# Altium schematic sheet 09_DIGITAL_IO.SchDoc: Схема электрическая принципиальная
size 420 x 297 mm; ApprovedBy: Скрябин; CheckedBy: Скрябин; Author: Корсунов; CompanyName: РТУ МИРЭА; SheetNumber: 9; SheetTotal: 11; PageSetup: Record=PageOptions|CenterHorizontal=True|CenterVertical=True|PrintScale=0.94|XCorrection=1.00|YCorrection=1.00|PrintKind=1|BorderSize=5000000|LeftOffset=0|BottomOffset=0|Orientation=1|PaperLength=1000|PaperWidth=1000|Scale=100|PaperSource=7|PrintQuality=-4|MediaType=1|DitherType=10|PaperKind=A4|PrintScaleMode=1; DecimalNumber: RP23.000001.009 Э3; Name1: Модуль ввода-вывода; lit_A: О; Name2: RP2350 OPC UA
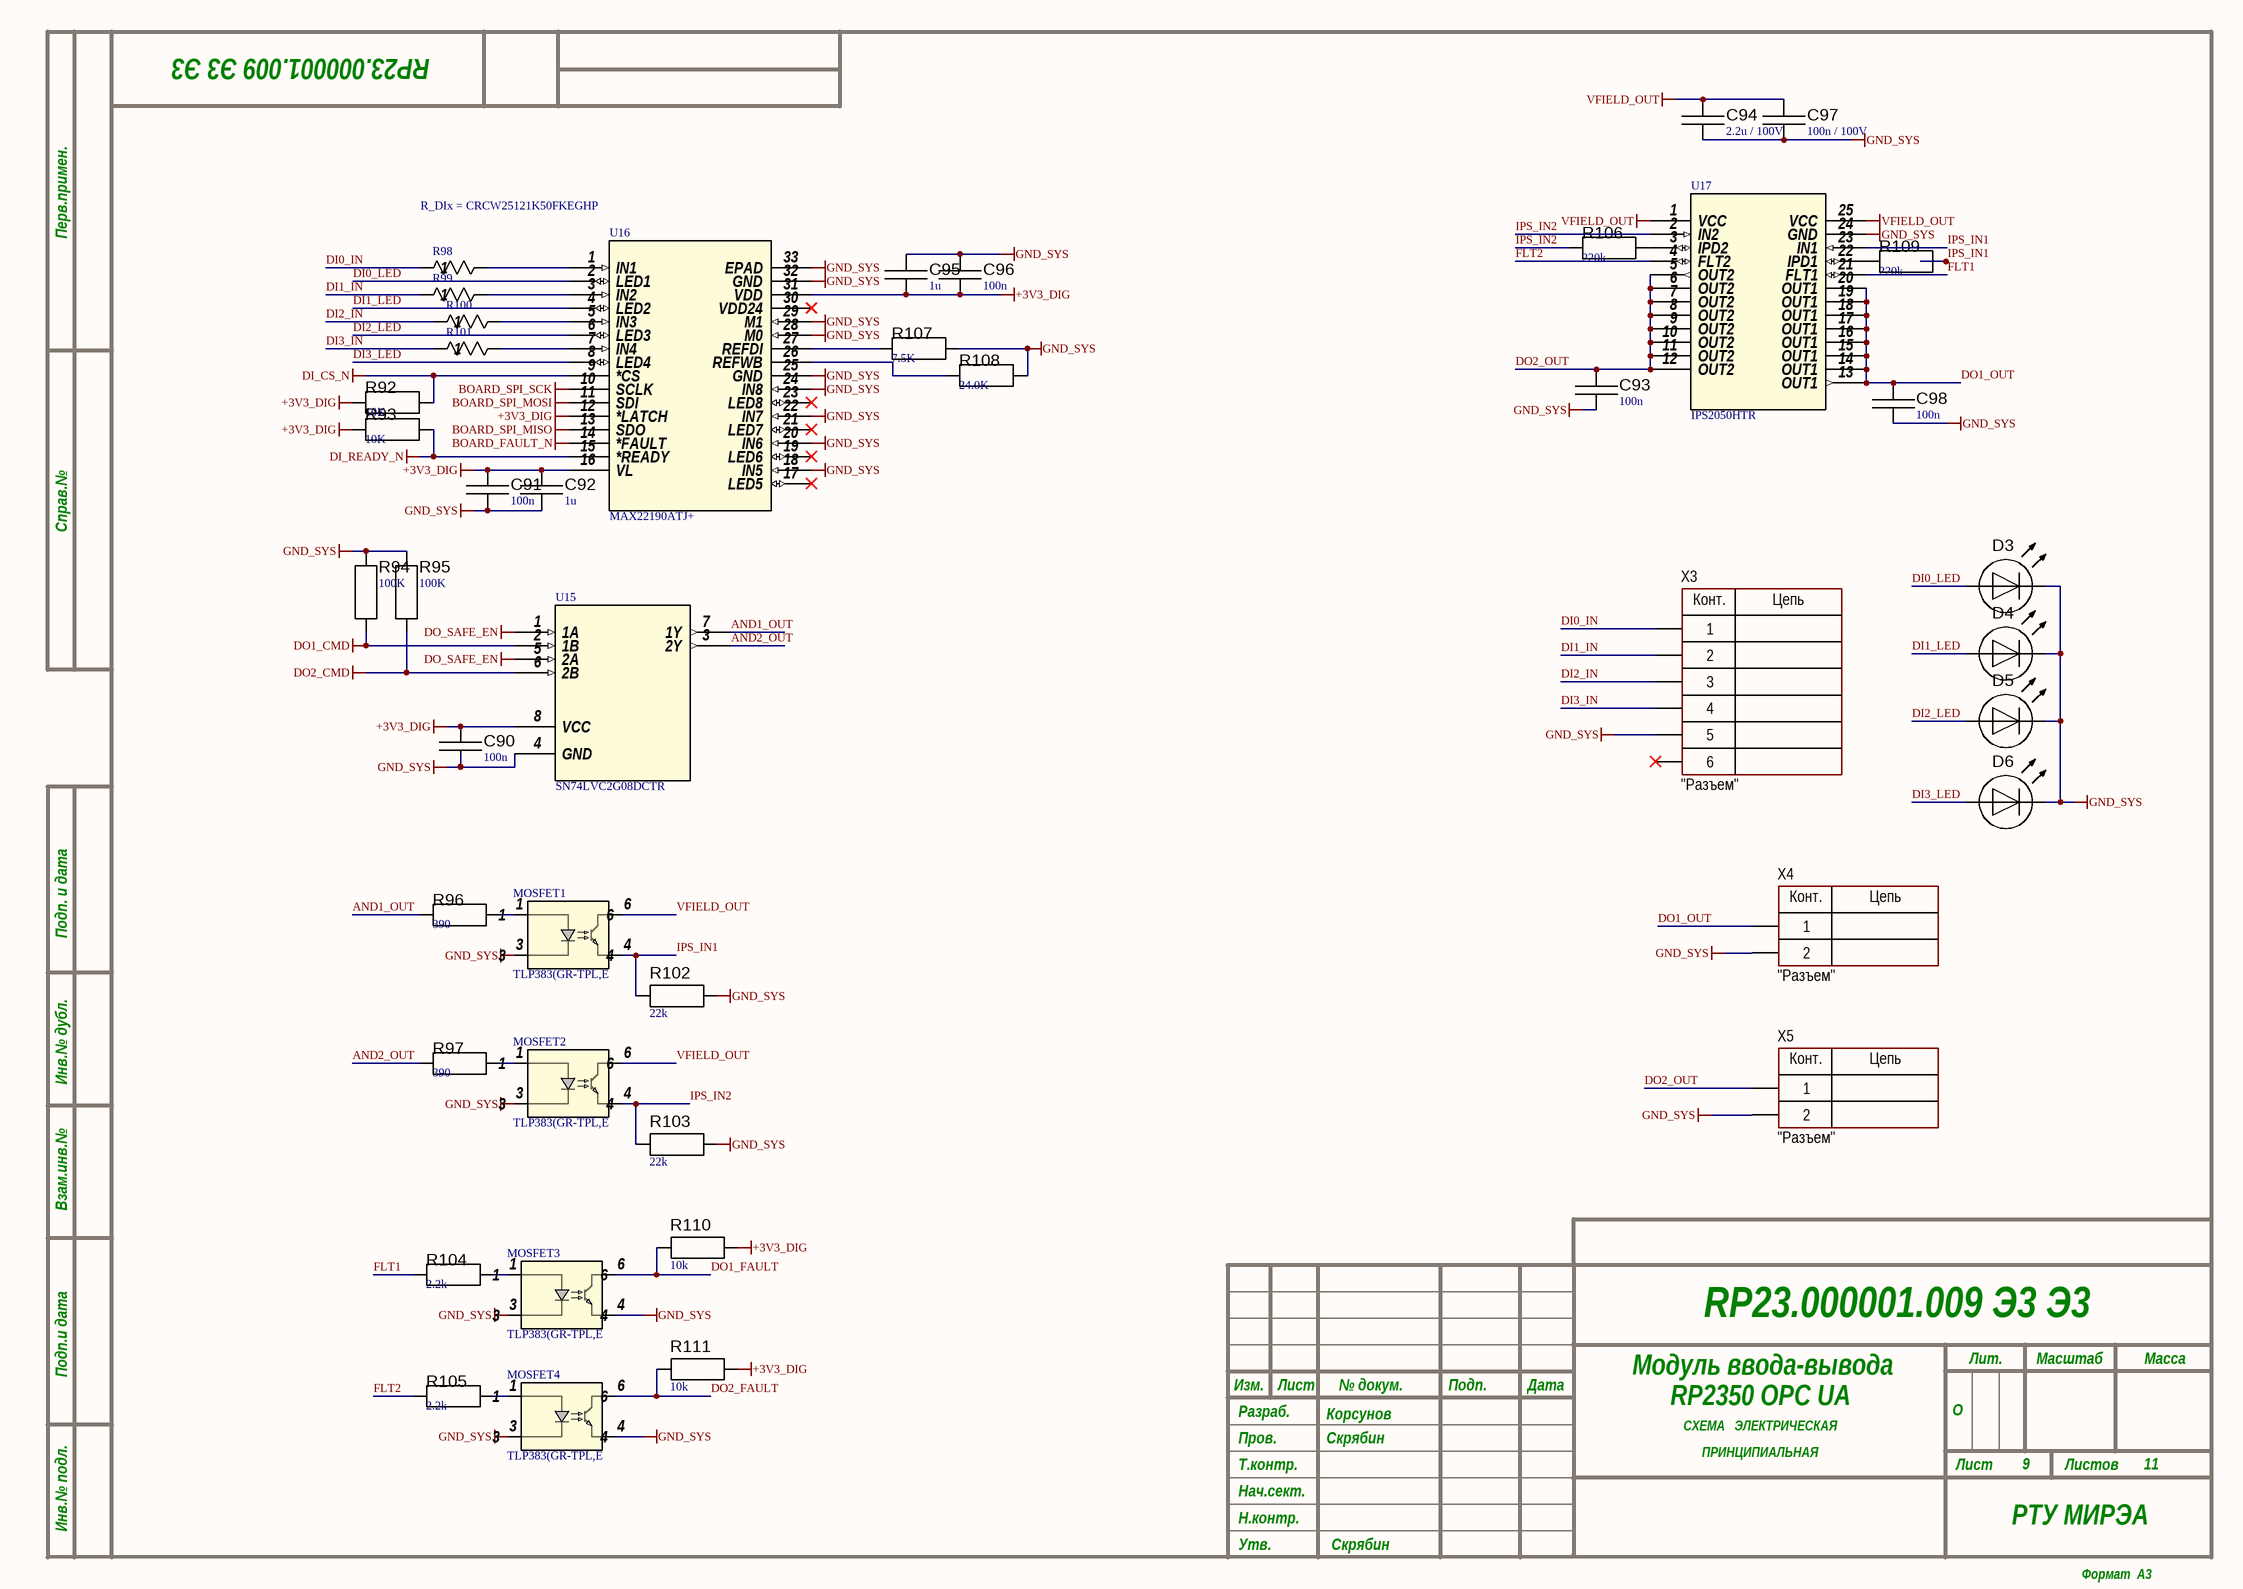
[diagram p0: 09_DIGITAL_IO.SchDoc]

## Parts
C90  value 100n  [C_0603]  (hidden comment: Capacitor)
C91  value 100n  [C_0603]  (hidden comment: Capacitor)
C92  value 1u  [C_0603]  (hidden comment: Capacitor)
C93  value 100n  [C_0603]  (hidden comment: Capacitor)
C94  value 2.2u / 100V  [C_1206]  (hidden comment: Capacitor)
C95  value 1u  [C_0603]  (hidden comment: Capacitor)
C96  value 100n  [C_0603]  (hidden comment: Capacitor)
C97  value 100n / 100V  [C_0603]  (hidden comment: Capacitor)
C98  value 100n  [C_0603]  (hidden comment: Capacitor)
D3  Light-Emitting Diode  [LED_PLCC2_3528]  (value not drawn)
D4  Light-Emitting Diode  [LED_PLCC2_3528]  (value not drawn)
D5  Light-Emitting Diode  [LED_PLCC2_3528]  (value not drawn)
D6  Light-Emitting Diode  [LED_PLCC2_3528]  (value not drawn)
MOSFET1  TLP383(GR-TPL,E  [4pin SO6L_TOS]
MOSFET2  TLP383(GR-TPL,E  [4pin SO6L_TOS]
MOSFET3  TLP383(GR-TPL,E  [4pin SO6L_TOS]
MOSFET4  TLP383(GR-TPL,E  [4pin SO6L_TOS]
R92  value 10K  [R_0603]  (hidden comment: Resistor)
R93  value 10K  [R_0603]  (hidden comment: Resistor)
R94  value 100K  [R_0603]  (hidden comment: Resistor)
R95  value 100K  [R_0603]  (hidden comment: Resistor)
R96  value 390  [R_0603]  (hidden comment: Resistor)
R97  value 390  [R_0603]  (hidden comment: Resistor)
R98  CRCW25121K50FKEGHP  [RES_0FKEGHP_VIS]  (value not drawn)
R99  CRCW25121K50FKEGHP  [RES_0FKEGHP_VIS]  (value not drawn)
R100  CRCW25121K50FKEGHP  [RES_0FKEGHP_VIS]  (value not drawn)
R101  CRCW25121K50FKEGHP  [RES_0FKEGHP_VIS]  (value not drawn)
R102  value 22k  [R_0603]  (hidden comment: Resistor)
R103  value 22k  [R_0603]  (hidden comment: Resistor)
R104  value 2.2k  [R_0603]  (hidden comment: Resistor)
R105  value 2.2k  [R_0603]  (hidden comment: Resistor)
R106  value 220k  [R_0603]  (hidden comment: Resistor)
R107  value 7.5K  [R_0603]  (hidden comment: Resistor)
R108  value 24.0K  [R_0603]  (hidden comment: Resistor)
R109  value 220k  [R_0603]  (hidden comment: Resistor)
R110  value 10k  [R_0603]  (hidden comment: Resistor)
R111  value 10k  [R_0603]  (hidden comment: Resistor)
U15  SN74LVC2G08DCTR  [DCT8]
U16  MAX22190ATJ+  [21-0140L_T3255-5_MXM]
U17  IPS2050HTR  [POWERSSO-24_STM]
X3  CommentText: "Разъем"  [CON: DG350-3.5-06P]
X4  CommentText: "Разъем"  [CON: DG350-3.5-02P]
X5  CommentText: "Разъем"  [CON: DG350-3.5-02P]

## Nets
+3V3_DIG: C90.1 C91.1 C92.1 C95.1 C96.1 R92.1 R93.1 R110.1 R111.1 U15.8(VCC) U16.12(*LATCH) U16.16(VL) U16.31(VDD)
BOARD_FAULT_N: U16.14(*FAULT)
BOARD_SPI_MISO: U16.13(SDO)
BOARD_SPI_MOSI: U16.11(SDI)
BOARD_SPI_SCK: U16.10(SCLK)
DI_CS_N: R92.2 U16.9(*CS)
DI_READY_N: R93.2 U16.15(*READY)
DO1_CMD: R94.1 U15.2(1B)
DO2_CMD: R95.1 U15.6(2B)
DO_SAFE_EN: U15.1(1A) U15.5(2A)
GND_SYS: C90.2 C91.2 C92.2 C93.1 C94.1 C95.2 C96.2 C97.1 C98.1 D3.2(C) D4.2(C) D5.2(C) D6.2(C) MOSFET1.3 MOSFET2.3 MOSFET3.3 MOSFET3.4 MOSFET4.3 MOSFET4.4 R94.2 R95.2 R102.1 R103.1 R107.2 R108.2 U15.4(GND) U16.18(IN5) U16.20(IN6) U16.22(IN7) U16.24(IN8) U16.25(GND) U16.28(M0) U16.29(M1) U16.32(GND) U16.33(EPAD) U17.24(GND) X3.5 X4.2 X5.2
VFIELD_OUT: C94.2 C97.2 MOSFET1.6 MOSFET2.6 U17.1(VCC) U17.25(VCC)
AND1_OUT: R96.1 U15.7(1Y)
AND2_OUT: R97.1 U15.3(2Y)
DI0_IN: R98.1 X3.1
DI0_LED: D3.1(A) U16.2(LED1)
DI1_IN: R99.1 X3.2
DI1_LED: D4.1(A) U16.4(LED2)
DI2_IN: R100.1 X3.3
DI2_LED: D5.1(A) U16.6(LED3)
DI3_IN: R101.1 X3.4
DI3_LED: D6.1(A) U16.8(LED4)
DO1_FAULT: MOSFET3.6 R110.2
DO1_OUT: C98.2 U17.13(OUT1) U17.14(OUT1) U17.15(OUT1) U17.16(OUT1) U17.17(OUT1) U17.18(OUT1) U17.19(OUT1) U17.20(OUT1) X4.1
DO2_FAULT: MOSFET4.6 R111.2
DO2_OUT: C93.2 U17.5(OUT2) U17.6(OUT2) U17.7(OUT2) U17.8(OUT2) U17.9(OUT2) U17.10(OUT2) U17.11(OUT2) U17.12(OUT2) X5.1
FLT1: R104.1 U17.21(FLT1)
FLT2: R105.1 U17.4(FLT2)
IPS_IN1: MOSFET1.4 R102.2 R109.2 U17.23(IN1)
IPS_IN2: MOSFET2.4 R103.2 R106.1 U17.2(IN2)
NetMOSFET1_1: MOSFET1.1 R96.2
NetMOSFET2_1: MOSFET2.1 R97.2
NetMOSFET3_1: MOSFET3.1 R104.2
NetMOSFET4_1: MOSFET4.1 R105.2
NetR98_2: R98.2 U16.1(IN1)
NetR99_2: R99.2 U16.3(IN2)
NetR100_2: R100.2 U16.5(IN3)
NetR101_2: R101.2 U16.7(IN4)
NetR106_2: R106.2 U17.3(IPD2)
NetR107_1: R107.1 U16.27(REFDI)
NetR108_1: R108.1 U16.26(REFWB)
NetR109_1: R109.1 U17.22(IPD1)

Not connected (* = marked no-connect by the designer): U16 17(LED5)* 19(LED6)* 21(LED7)* 23(LED8)* 30(VDD24)*; X3 6*

## Notes on the sheet
- R_DIx = CRCW25121K50FKEGHP
- Перв.примен.
- Справ.№
- Подп. и дата
- Инв.№ дубл.
- Взам.инв.№
- Подп.и дата
- Разраб.
- Изм.
- Лист
- № докум.
- Подп.
- Дата
- Лит.
- Масштаб
- Масса
- Т.контр.
- Пров.
- СХЕМА   ЭЛЕКТРИЧЕСКАЯ
- ПРИНЦИПИАЛЬНАЯ
- Листов
- Инв.№ подл.
- Утв.
- Н.контр.
- Нач.сект.
- Формат  A3
- (in symbol Connector_terminal_2pin) Конт.; Цепь
- (in symbol Connector_terminal_6pin) Конт.; Цепь

## Library data of the parts
C90-C98 = Capacitor: SimulationGenericComponent: True
D3-D6 = LED: AF: 1; BV: 0; BV_MAX: 1e99; EG: 1.11; FC: 0.5; IBV: 0.001; IS: 1e-14; MJSW: 0.33; NTUN: 30; TNOM: 27; XTI: 3; SimulationGenericComponent: True; CJO: 0; CJP: 0; CTA: 0; CTP: 0; FCS: 0.5; FV_MAX: 1e99; IKF: 0; IKR: 0; ISR: 1e-14; JSW: 0; JTUN: 0; JTUNSW: 0; KEG: 1; KF: 0; LEVEL: 1; N: 1; NBV: 1; NR: 1; NS: 1; PHP: 1; RS: 0; TCV: 0; TLEV: 0; TLEVC: 0; TM1: 0; TM2: 0; TPB: 0; TPHP: 0; TRS: 0; TRS2: 0; TT: 0; TTT1: 0; TTT2: 0; VJ: 1; XTITUN: 3
MOSFET1-MOSFET4 = TLP383GR-TPL,E: Photocoupler (phototransistor output), DC input, 5000 Vrms, 4pin SO6L; Manufacturer_Name: Toshiba Electronic Devices & Storage Corp.; Number_devices_in_Package: 1; Copyright: Copyright (C) 2026 Ultra Librarian. All rights reserved.; Manufacturer_Part_Number: TLP383(GR-TPL,E; Datasheet: https://toshiba.semicon-storage.com/info/docget.jsp?did=28830&prodName=TLP383; Source_Package: TLP383; RefDes: Refdes; Type: Type
R92-R97 R102-R111 = Resistor: TC1: 0; SimulationGenericComponent: True; TC2: 0
R98-R101 = CRCW25121K50FKEGHP: CRCW2512-HP 100 1K5 1% E67 E3; Manufacturer_Name: Vishay; Type: Chip Resistor - Surface Mount; Copyright: Copyright (C) 2026 Ultra Librarian. All rights reserved.; Manufacturer_Part_Number: CRCW25121K50FKEGHP; Datasheet: https://www.vishay.com/doc?20043
U15 = SN74LVC2G08DCTR: 2-ch, 2-input 1.65-V to 5.5-V 32 mA drive strength AND gate 8-SSOP -40 to 125; Manufacturer_Name: Texas Instruments; Copyright: Copyright (C) 2026 Ultra Librarian. All rights reserved.; Manufacturer_Part_Number: SN74LVC2G08DCTR; RefDes: RefDes; Type: Type
U16 = MAX22190ATJ+: Octal Industrial Digital Input with Diagnostics; Manufacturer_Name: Analog Devices Inc; Copyright: Copyright (C) 2026 Ultra Librarian. All rights reserved.; Manufacturer_Part_Number: MAX22190ATJ+; RefDes: RefDes; Type: Type
U17 = IPS2050HTR: High efficiency, high-side switch with extended diagnostics and smart driving for capacitive loads; Manufacturer_Name: STMicroelectronics; Copyright: Copyright (C) 2026 Ultra Librarian. All rights reserved.; Manufacturer_Part_Number: IPS2050HTR; Datasheet: https://www.st.com/resource/en/datasheet/ips2050h.pdf; RefDes: RefDes; Type: Type
X3 = Connector_terminal_6pin: Manufacturer: Degson; ValueManufacturerPartNumber: Terminal connector, 6pin, 3.5mm, 300VAC, 10A; PartNumber: DG350-3.5-06P-14; TypeConnector: Terminal connector; VoltageMax: 300VAC; Pitch: 3.5mm; CurrentMax: 10A; Multichannel: 6pin; HelpURL: https://www.compel.ru/infosheet/DEGSON/DG350-3.5-06P-14-00AH
X4 X5 = Connector_terminal_2pin: Manufacturer: Degson; ValueManufacturerPartNumber: Terminal connector, 2pin, 3.5mm, 300VAC, 10A; PartNumber: DG350-3.5-02P-14; TypeConnector: Terminal connector; VoltageMax: 300VAC; Pitch: 3.5mm; CurrentMax: 10A; Multichannel: 2pin; HelpURL: https://www.chipdip.ru/product/dg350-3.5-02p-12